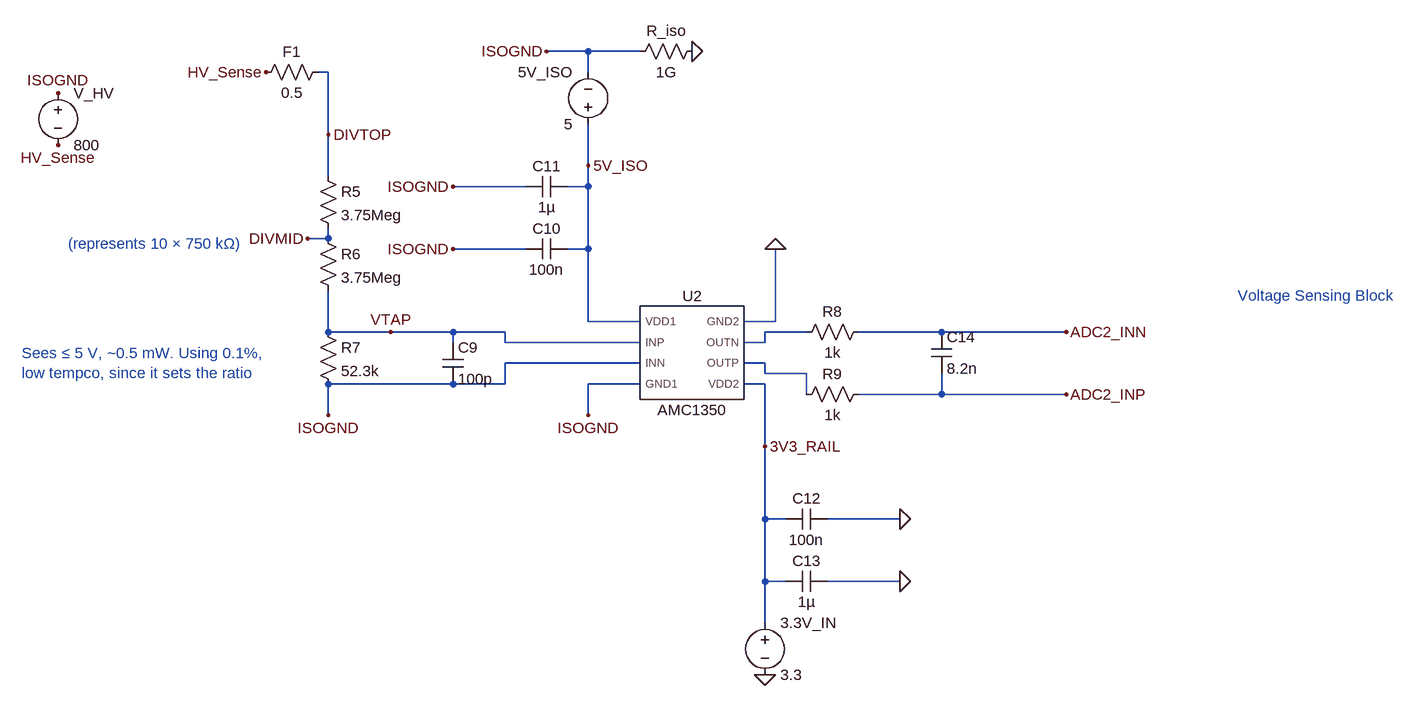
[diagram p0: schematic voltage_block.asc]
voltage_block.asc, the LTspice schematic file:
Version 4.1
SHEET 1 2132 1664
WIRE 352 640 288 640
WIRE 432 640 352 640
WIRE -48 672 -64 672
WIRE 352 672 352 640
WIRE -48 768 -48 672
WIRE 352 816 352 752
WIRE -48 832 -48 768
WIRE 256 848 144 848
WIRE 352 848 352 816
WIRE 352 848 320 848
WIRE -48 928 -48 912
WIRE -48 928 -80 928
WIRE 256 944 144 944
WIRE 352 944 352 848
WIRE 352 944 320 944
WIRE 352 1056 352 944
WIRE 432 1056 352 1056
WIRE 640 1056 640 944
WIRE 640 1056 592 1056
WIRE -48 1072 -48 1008
WIRE 48 1072 -48 1072
WIRE 144 1072 48 1072
WIRE 224 1072 144 1072
WIRE 688 1072 624 1072
WIRE 896 1072 768 1072
WIRE 1088 1072 896 1072
WIRE 144 1088 144 1072
WIRE 224 1088 224 1072
WIRE 432 1088 224 1088
WIRE 624 1088 624 1072
WIRE 624 1088 592 1088
WIRE 432 1120 224 1120
WIRE 624 1120 592 1120
WIRE 624 1136 624 1120
WIRE 688 1136 624 1136
WIRE 144 1152 -48 1152
WIRE 224 1152 224 1120
WIRE 224 1152 144 1152
WIRE 432 1152 352 1152
WIRE 624 1152 592 1152
WIRE 688 1168 688 1136
WIRE 896 1168 896 1136
WIRE 896 1168 768 1168
WIRE 1088 1168 896 1168
WIRE -48 1200 -48 1152
WIRE 352 1200 352 1152
WIRE 624 1248 624 1152
WIRE 624 1360 624 1248
WIRE 656 1360 624 1360
WIRE 832 1360 720 1360
WIRE 624 1456 624 1360
WIRE 656 1456 624 1456
WIRE 832 1456 720 1456
WIRE 624 1520 624 1456
FLAG -48 1200 ISOGND
FLAG 144 848 ISOGND
FLAG 144 944 ISOGND
FLAG 352 1200 ISOGND
FLAG 832 1456 0
FLAG 832 1360 0
FLAG 1088 1168 ADC2_INP
FLAG 1088 1072 ADC2_INN
FLAG 288 640 ISOGND
FLAG 640 944 0
FLAG -144 672 HV_Sense
FLAG -464 704 ISOGND
FLAG -464 784 HV_Sense
FLAG 512 640 0
FLAG 624 1600 0
FLAG -48 768 DIVTOP
FLAG 48 1072 VTAP
FLAG 352 816 5V_ISO
FLAG -80 928 DIVMID
FLAG 624 1248 3V3_RAIL
SYMBOL res -64 816 R0
SYMATTR InstName R5
SYMATTR Value 3.75Meg
SYMBOL res -64 912 R0
SYMATTR InstName R6
SYMATTR Value 3.75Meg
SYMBOL res -64 1056 R0
SYMATTR InstName R7
SYMATTR Value 52.3k
SYMBOL cap 128 1088 R0
SYMATTR InstName C9
SYMATTR Value 100p
SYMBOL AMC1350 512 1104 R0
SYMATTR InstName U2
SYMBOL cap 320 928 R90
WINDOW 0 0 32 VBottom 2
WINDOW 3 32 32 VTop 2
SYMATTR InstName C10
SYMATTR Value 100n
SYMBOL cap 320 832 R90
WINDOW 0 0 32 VBottom 2
WINDOW 3 32 32 VTop 2
SYMATTR InstName C11
SYMATTR Value 1µ
SYMBOL cap 656 1376 R270
WINDOW 0 32 32 VTop 2
WINDOW 3 0 32 VBottom 2
SYMATTR InstName C12
SYMATTR Value 100n
SYMBOL cap 656 1472 R270
WINDOW 0 32 32 VTop 2
WINDOW 3 0 32 VBottom 2
SYMATTR InstName C13
SYMATTR Value 1µ
SYMBOL res 784 1056 R90
WINDOW 0 0 56 VBottom 2
WINDOW 3 32 56 VTop 2
SYMATTR InstName R8
SYMATTR Value 1k
SYMBOL res 784 1152 R90
WINDOW 0 0 56 VBottom 2
WINDOW 3 32 56 VTop 2
SYMATTR InstName R9
SYMATTR Value 1k
SYMBOL cap 880 1072 R0
SYMATTR InstName C14
SYMATTR Value 8.2n
SYMBOL res -48 656 R90
WINDOW 0 0 56 VBottom 2
WINDOW 3 32 56 VTop 2
SYMATTR InstName F1
SYMATTR Value 0.5
SYMBOL voltage -464 688 R0
WINDOW 123 0 0 Left 0
WINDOW 39 0 0 Left 0
SYMATTR InstName V_HV
SYMATTR Value 800
SYMBOL res 528 624 R90
WINDOW 0 0 56 VBottom 2
WINDOW 3 32 56 VTop 2
SYMATTR InstName R_iso
SYMATTR Value 1G
SYMBOL voltage 352 768 R180
WINDOW 0 24 96 Left 2
WINDOW 3 24 16 Left 2
WINDOW 123 0 0 Left 0
WINDOW 39 0 0 Left 0
SYMATTR InstName 5V_ISO
SYMATTR Value 5
SYMBOL voltage 624 1504 R0
WINDOW 123 0 0 Left 0
WINDOW 39 0 0 Left 0
SYMATTR InstName 3.3V_IN
SYMATTR Value 3.3
TEXT 1352 1016 Left 2 ;Voltage Sensing Block
TEXT -448 936 Left 2 ;(represents 10 × 750 kΩ)
TEXT -520 1104 Left 2 ;Sees ≤ 5 V, ~0.5 mW. Using 0.1%, \nlow tempco, since it sets the ratio

The netlist it stands for:
* voltage_block.asc
R5 DIVTOP DIVMID 3.75Meg
R6 DIVMID VTAP 3.75Meg
R7 VTAP ISOGND 52.3k
C9 VTAP ISOGND 100p
X§U2 5V_ISO VTAP ISOGND ISOGND 0 N001 N002 3V3_RAIL AMC1350  ; pins VDD1 INP INN GND1 GND2 OUTN OUTP VDD2
C10 5V_ISO ISOGND 100n
C11 5V_ISO ISOGND 1µ
C12 3V3_RAIL 0 100n
C13 3V3_RAIL 0 1µ
R8 ADC2_INN N001 1k
R9 ADC2_INP N002 1k
C14 ADC2_INN ADC2_INP 8.2n
R§F1 DIVTOP HV_Sense 0.5
V_HV ISOGND HV_Sense 800
R_iso 0 ISOGND 1G
V§5V_ISO 5V_ISO ISOGND 5
V§3.3V_IN 3V3_RAIL 0 3.3
* Voltage Sensing Block
* (represents 10 × 750 kΩ)
* Sees ≤ 5 V, ~0.5 mW. Using 0.1%,
* low tempco, since it sets the ratio
.lib AMC1350.lib
.backanno
.end